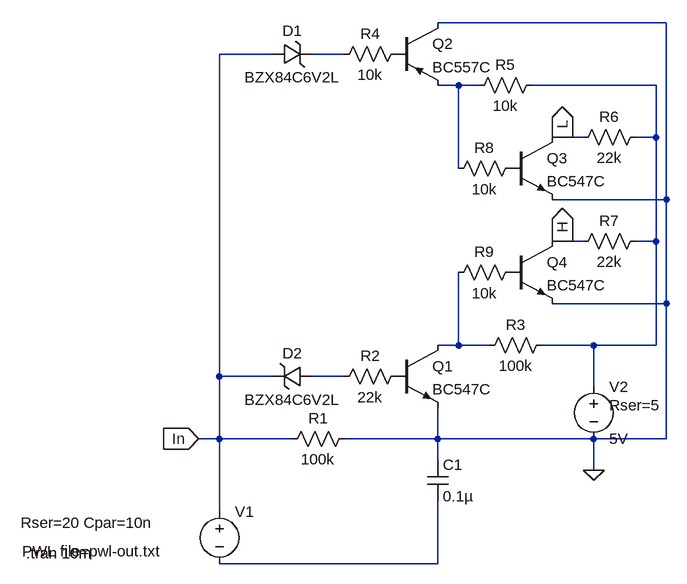
[diagram p0: schematic Pegelkonverter5.asc]
Pegelkonverter5.asc, the LTspice schematic file:
Version 4
SHEET 1 1288 680
WIRE 672 -1104 320 -1104
WIRE 64 -1056 -16 -1056
WIRE 176 -1056 128 -1056
WIRE 352 -1008 320 -1008
WIRE 384 -1008 352 -1008
WIRE 656 -1008 464 -1008
WIRE 512 -928 496 -928
WIRE 544 -928 512 -928
WIRE 656 -928 656 -1008
WIRE 656 -928 624 -928
WIRE 352 -880 352 -1008
WIRE 672 -832 672 -1104
WIRE 672 -832 496 -832
WIRE 512 -768 496 -768
WIRE 544 -768 512 -768
WIRE 656 -768 656 -928
WIRE 656 -768 624 -768
WIRE 672 -672 672 -832
WIRE 672 -672 496 -672
WIRE 352 -608 352 -720
WIRE 352 -608 320 -608
WIRE 400 -608 352 -608
WIRE 560 -608 480 -608
WIRE 656 -608 656 -768
WIRE 656 -608 560 -608
WIRE -16 -560 -16 -1056
WIRE 64 -560 -16 -560
WIRE 176 -560 128 -560
WIRE 560 -544 560 -608
WIRE -16 -464 -16 -560
WIRE -16 -464 -48 -464
WIRE 96 -464 -16 -464
WIRE 320 -464 320 -512
WIRE 320 -464 176 -464
WIRE 560 -464 320 -464
WIRE 672 -464 672 -672
WIRE 672 -464 560 -464
WIRE 320 -432 320 -464
WIRE 560 -416 560 -464
WIRE -16 -352 -16 -464
WIRE 320 -272 320 -368
WIRE 320 -272 -16 -272
FLAG 560 -416 0
FLAG -48 -464 In
IOPIN -48 -464 In
FLAG 512 -928 L
IOPIN 512 -928 Out
FLAG 512 -768 H
IOPIN 512 -768 Out
SYMBOL voltage -16 -368 R0
WINDOW 3 -304 77 Left 2
WINDOW 123 24 44 Left 2
WINDOW 39 -306 33 Left 2
SYMATTR InstName V1
SYMATTR Value PWL file=pwl-out.txt
SYMATTR SpiceLine Rser=20 Cpar=10n
SYMBOL res 192 -480 R90
WINDOW 0 0 56 VBottom 2
WINDOW 3 32 56 VTop 2
SYMATTR InstName R1
SYMATTR Value 100k
SYMATTR SpiceLine tol=5
SYMBOL cap 304 -432 R0
SYMATTR InstName C1
SYMATTR Value 0.1µ
SYMATTR SpiceLine V=25 Irms=728m Rser=0.14361 Lser=0 mfg="KEMET" pn="C0603C104K3RAC" type="X7R"
SYMBOL npn 256 -608 R0
SYMATTR InstName Q1
SYMATTR Value BC547C
SYMBOL res 272 -576 R90
WINDOW 0 0 56 VBottom 2
WINDOW 3 32 56 VTop 2
SYMATTR InstName R2
SYMATTR Value 22k
SYMATTR SpiceLine tol=5
SYMBOL voltage 560 -560 R0
WINDOW 123 0 0 Left 0
WINDOW 39 24 44 Left 2
SYMATTR InstName V2
SYMATTR Value 5V
SYMATTR SpiceLine Rser=5
SYMBOL res 496 -624 R90
WINDOW 0 0 56 VBottom 2
WINDOW 3 32 56 VTop 2
SYMATTR InstName R3
SYMATTR Value 100k
SYMBOL pnp 256 -1104 R0
SYMATTR InstName Q2
SYMATTR Value BC557C
SYMBOL res 272 -1072 R90
WINDOW 0 0 56 VBottom 2
WINDOW 3 32 56 VTop 2
SYMATTR InstName R4
SYMATTR Value 10k
SYMATTR SpiceLine tol=5
SYMBOL res 480 -1024 R90
WINDOW 0 0 56 VBottom 2
WINDOW 3 32 56 VTop 2
SYMATTR InstName R5
SYMATTR Value 10k
SYMATTR SpiceLine tol=5
SYMBOL npn 432 -928 R0
SYMATTR InstName Q3
SYMATTR Value BC547C
SYMBOL res 640 -944 R90
WINDOW 0 0 56 VBottom 2
WINDOW 3 32 56 VTop 2
SYMATTR InstName R6
SYMATTR Value 22k
SYMATTR SpiceLine tol=5
SYMBOL npn 432 -768 R0
SYMATTR InstName Q4
SYMATTR Value BC547C
SYMBOL res 640 -784 R90
WINDOW 0 0 56 VBottom 2
WINDOW 3 32 56 VTop 2
SYMATTR InstName R7
SYMATTR Value 22k
SYMATTR SpiceLine tol=5
SYMBOL res 448 -896 R90
WINDOW 0 0 56 VBottom 2
WINDOW 3 32 56 VTop 2
SYMATTR InstName R8
SYMATTR Value 10k
SYMBOL res 448 -736 R90
WINDOW 0 0 56 VBottom 2
WINDOW 3 32 56 VTop 2
SYMATTR InstName R9
SYMATTR Value 10k
SYMBOL zener 64 -1040 R270
WINDOW 0 36 32 VTop 2
WINDOW 3 -4 32 VBottom 2
SYMATTR InstName D1
SYMATTR Value BZX84C6V2L
SYMBOL zener 128 -576 R90
WINDOW 0 -4 32 VBottom 2
WINDOW 3 36 32 VTop 2
SYMATTR InstName D2
SYMATTR Value BZX84C6V2L
TEXT -314 -288 Left 2 !.tran 10m

The netlist it stands for:
* Pegelkonverter5.asc
V1 In N006 PWL file=pwl-out.txt Rser=20 Cpar=10n
R1 0 In 100k tol=5
C1 0 N006 0.1µ V=25 Irms=728m Rser=0.14361 Lser=0 mfg="KEMET" pn="C0603C104K3RAC" type="X7R"
Q1 N004 P001 0 0 BC547C
R2 P001 N005 22k tol=5
V2 N003 0 5V Rser=5
R3 N003 N004 100k
Q2 0 P002 N002 0 BC557C
R4 P002 N001 10k tol=5
R5 N003 N002 10k tol=5
Q3 L P003 0 0 BC547C
R6 N003 L 22k tol=5
Q4 H P004 0 0 BC547C
R7 N003 H 22k tol=5
R8 P003 N002 10k
R9 P004 N004 10k
D1 In N001 BZX84C6V2L
D2 N005 In BZX84C6V2L
.model D D
.lib standard.dio
.model NPN NPN
.model PNP PNP
.lib standard.bjt
.tran 10m
.backanno
.end